# Altium schematic sheet 05_USB_UART_Service.SchDoc: USB_UART_Service
size A4; SheetNumber: 6; SheetTotal: 12
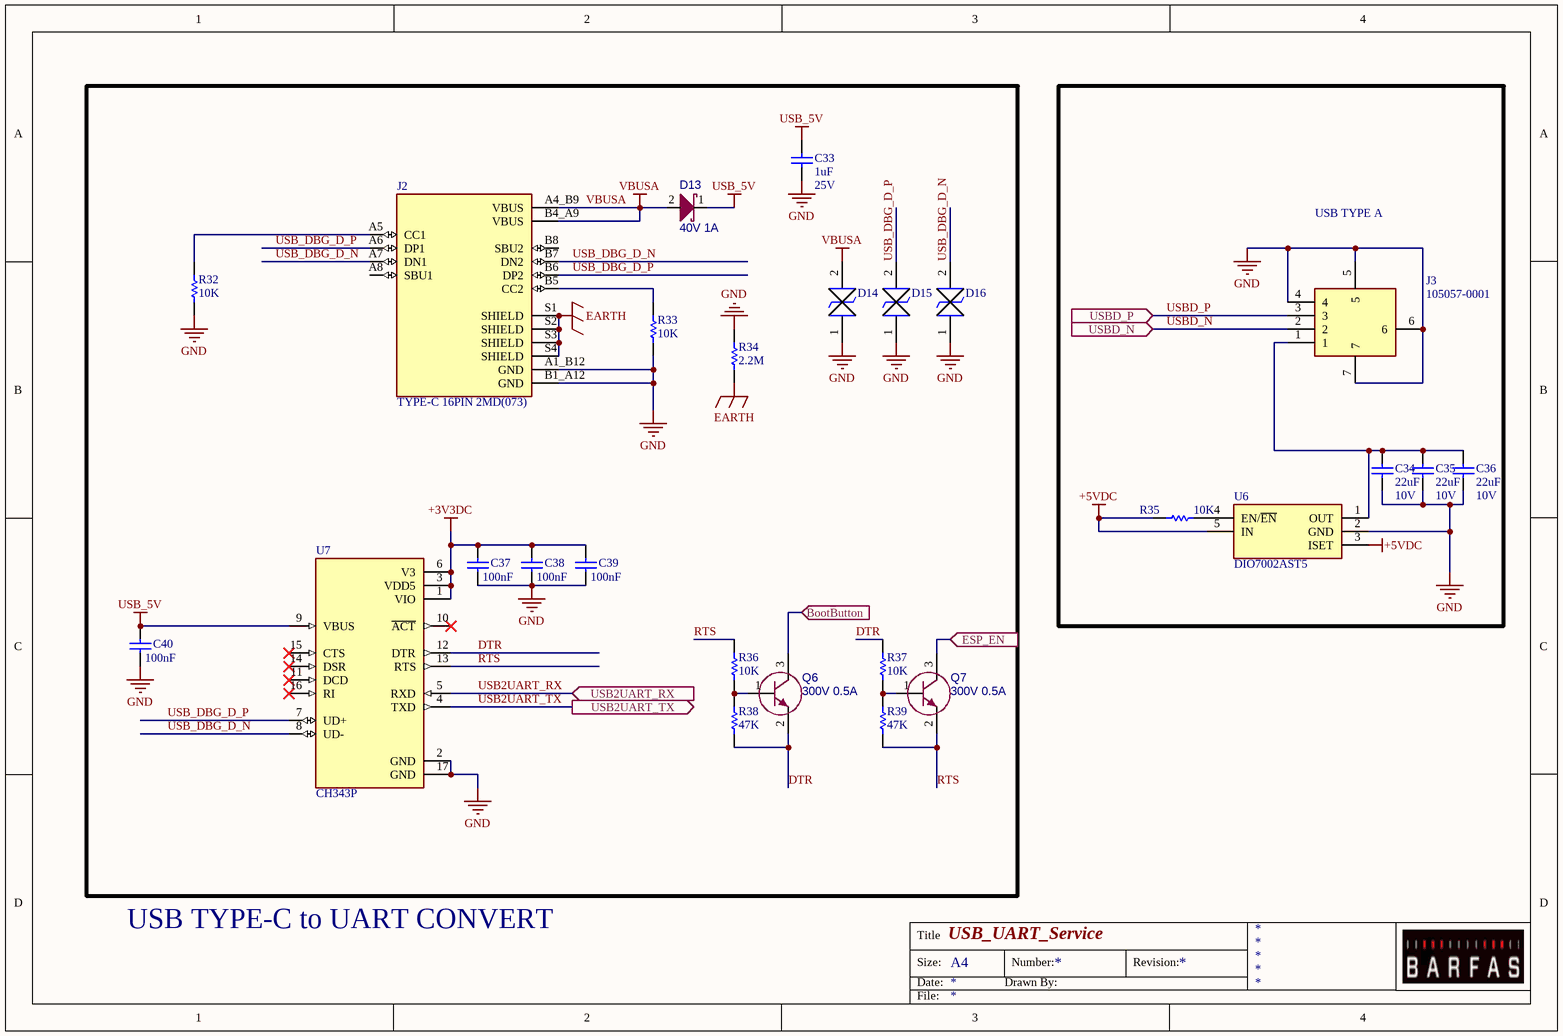
[diagram p0: 05_USB_UART_Service.SchDoc]

## Parts
C33  value 1uF  Voltage: 25V  [CAP_0603]  (hidden comment: CL10A105KA8NNNC)
C34  value 22uF  Voltage: 10V  [CAP_0805]  (hidden comment: CL21A226MPCLRNC)
C35  value 22uF  Voltage: 10V  [CAP_0805]  (hidden comment: CL21A226MPCLRNC)
C36  value 22uF  Voltage: 10V  [CAP_0805]  (hidden comment: CL21A226MPCLRNC)
C37  value 100nF  [CAP_0603]  (hidden comment: CL10B104KB8NNNL)
C38  value 100nF  [CAP_0603]  (hidden comment: CL10B104KB8NNNL)
C39  value 100nF  [CAP_0603]  (hidden comment: CL10B104KB8NNNL)
C40  value 100nF  [CAP_0603]  (hidden comment: CL10B104KB8NNNL)
D13  value 40V 1A  [SOD-123]  (hidden comment: PMEG4010EGWJ)
D14  ATV02W5V0B-HF  [SOD-123F]  (value not drawn)
D15  ATV02W5V0B-HF  [SOD-123F]  (value not drawn)
D16  ATV02W5V0B-HF  [SOD-123F]  (value not drawn)
J2  TYPE-C 16PIN 2MD(073)  [HRO_TYPE-C-31-M-12]
J3  105057-0001  [1050570001]
Q6  value 300V 0.5A  [SOT-23-3]  (hidden comment: MMBTA42_R1_00001)
Q7  value 300V 0.5A  [SOT-23-3]  (hidden comment: MMBTA42_R1_00001)
R32  value 10K  [RES_0402]  (hidden comment: RC0402JR-0710KL)
R33  value 10K  [RES_0402]  (hidden comment: RC0402JR-0710KL)
R34  value 2.2M  [RES_0805]  (hidden comment: RES)
R35  value 10K  [RES_0402]  (hidden comment: RC0402JR-0710KL)
R36  value 10K  [RES_0402]  (hidden comment: RC0402JR-0710KL)
R37  value 10K  [RES_0402]  (hidden comment: RC0402JR-0710KL)
R38  value 47K  [RES_0603]  (hidden comment: 0603SAF4702T5E)
R39  value 47K  [RES_0603]  (hidden comment: 0603SAF4702T5E)
U6  DIO7002AST5  [SOT95P280X125-5N]
U7  CH343P  [QFN50P300X300X80-17N]

## Blocks framed on the sheet
USB TYPE A: C34-C36 J3 R35 U6

## Ports
BootButton (in), ESP_EN (in), USB2UART_RX (in), USB2UART_TX (out), USBD_N (in), USBD_P (in)

## Nets
+3V3DC: C37.2 C38.2 C39.2 U7.1(VIO) U7.3(VDD5) U7.6(V3)
+5VDC: R35.2 U6.3(ISET) U6.5(IN)
EARTH: J2.S1(SHIELD) J2.S2(SHIELD) J2.S3(SHIELD) J2.S4(SHIELD) R34.1
GND: C33.2 C34.2 C35.2 C36.2 C37.1 C38.1 C39.1 C40.1 D14.1 D15.1 D16.1 J2.A1_B12(GND) J2.B1_A12(GND) J3.4 J3.5 J3.6 J3.7 R32.1 R33.1 R34.2 U6.2(GND) U7.2(GND) U7.17(GND)
USB_5V: C33.1 C40.2 D13.1 U7.9(VBUS)
VBUSA: D13.2 D14.2 J2.A4_B9(VBUS) J2.B4_A9(VBUS)
BootButton: Q6.3(C) ; port BootButton
DTR: Q6.2(E) R37.2 R38.1 U7.12(DTR)
ESP_EN: Q7.3(C) ; port ESP_EN
RTS: Q7.2(E) R36.2 R39.1 U7.13(RTS)
USB2UART_RX: U7.5(RXD) ; port USB2UART_RX
USB2UART_TX: U7.4(TXD) ; port USB2UART_TX
USB_DBG_D_N: D16.2 J2.A7(DN1) J2.B7(DN2) U7.8(UD-)
USB_DBG_D_P: D15.2 J2.A6(DP1) J2.B6(DP2) U7.7(UD+)
USBD_N: J3.2 ; port USBD_N
USBD_P: J3.3 ; port USBD_P
NetC34_1: C34.1 C35.1 C36.1 J3.1 U6.1(OUT)
NetJ2_A5: J2.A5(CC1) R32.2
NetJ2_B5: J2.B5(CC2) R33.2
NetQ6_1: Q6.1(B) R36.1 R38.2
NetQ7_1: Q7.1(B) R37.1 R39.2
NetR35_1: R35.1 U6.4(EN/~{EN})

Not connected (* = marked no-connect by the designer): J2 A8(SBU1) B8(SBU2); U7 10(~{ACT})* 11(DCD)* 14(DSR)* 15(CTS)* 16(RI)*

## Notes on the sheet
- USB TYPE-C to UART CONVERT
- Title
- Size:
- Date:
- A4
- Drawn By:
- Number:
- Revision:
- File:

## Library data of the parts
C33 = C01757: CAP CER 1UF 25VDC %10 X5R SMD; Manufacturer: Samsung; Manufacturer Part Number: CL10A105KA8NNNC
C34-C36 = C01758: MLCC (2012) 0805 22uF 10VDC ±20% X5R; Manufacturer: Samsung; Manufacturer Part Number: CL21A226MPCLRNC
C37-C40 = CL10B104KB8NNNL: MLCC (1608) 0603 100nF 50VDC ±10% X7R; Manufacturer: Samsung Electro-Mechanics America, Inc; Supplier 1: OZDISAN; Manufacturer Part Number: CL10B104KB8NNNL
D13 = PMEG4010EGWJ: DIODE SCHOTTKY 40V 1A SOD123; Manufacturer: Nexperia USA Inc.; Manufacturer Part Number: PMEG4010EGWJ
D14-D16 = ATV02W5V0B-HF: TVS Diode (Bi-directional); Manufacturer: Comchip Technology; Manufacturer Part Number: ATV02W5V0B-HF
J2 = TYPE-C-31-M-12: CONN RCPT Type-C 16POS SMD R/A; Manufacturer: SHOU HAN; Value: *; Manufacturer Part Number: TYPE-C 16PIN 2MD(073)
J3 = 105057-0001: CONN RCPT USB2.0 TYPEA 4POS VERT; Manufacturer: Molex; Manufacturer Part Number: 105057-0001
Q6 Q7 = MMBTA42_R1_00001: TRANSISTOR DIS.500mA 300V NPN SOT23 GEN. SMT; Manufacturer: PANJIT; Package: SOT23; Supplier Part Number 1: 3757-MMBTA42_R1_00001CT-ND; Supplier Part Number 2: *; Supplier Part Number 3: MMBTA42_R1_00001; Supplier 1: DIGIKEY; Supplier 2: MOUSER; Supplier 3: OZDISAN; Manufacturer Part Number: MMBTA42_R1_00001
R32 R33 R35-R37 = R03000: RES.(1005) 0402 10K Ohms 5% 1/16W 100PPM SMT; Manufacturer: YAGEO; Manufacturer Part Number: RC0402JR-0710KL
R34 = R01913: RES SMD 2.2M OHM 1% 1/8W 0805; Manufacturer: Yageo; Manufacturer Part Number: RC0805FR-072M2L
R38 R39 = 0603SAF4702T5E: RES.(1608) 0603 47K Ohms 1% 1/10W-S 100PPM; Manufacturer: ROYALOHM; Supplier 1: Ozdisan; Manufacturer Part Number: 0603SAF4702T5E
U6 = DIO7002AST5: Low Loss Power Distribution Switch; Manufacturer: DIOO Microcircuits; Manufacturer Part Number: DIO7002AST5
U7 = CH343P: USB to High-Speed Serial Chip CH343; Manufacturer: WCH; SnapEDA_Link: https://www.snapeda.com/parts/CH343P/WCH/view-part/?ref=snap; Package: Package; Value: *; Manufacturer Part Number: CH343P; Check_prices: https://www.snapeda.com/parts/CH343P/WCH/view-part/?ref=eda